# Altium schematic sheet Relay-10A-Sheet.SchDoc
size 420 x 297 mm; SheetNumber: 1; SheetTotal: 1
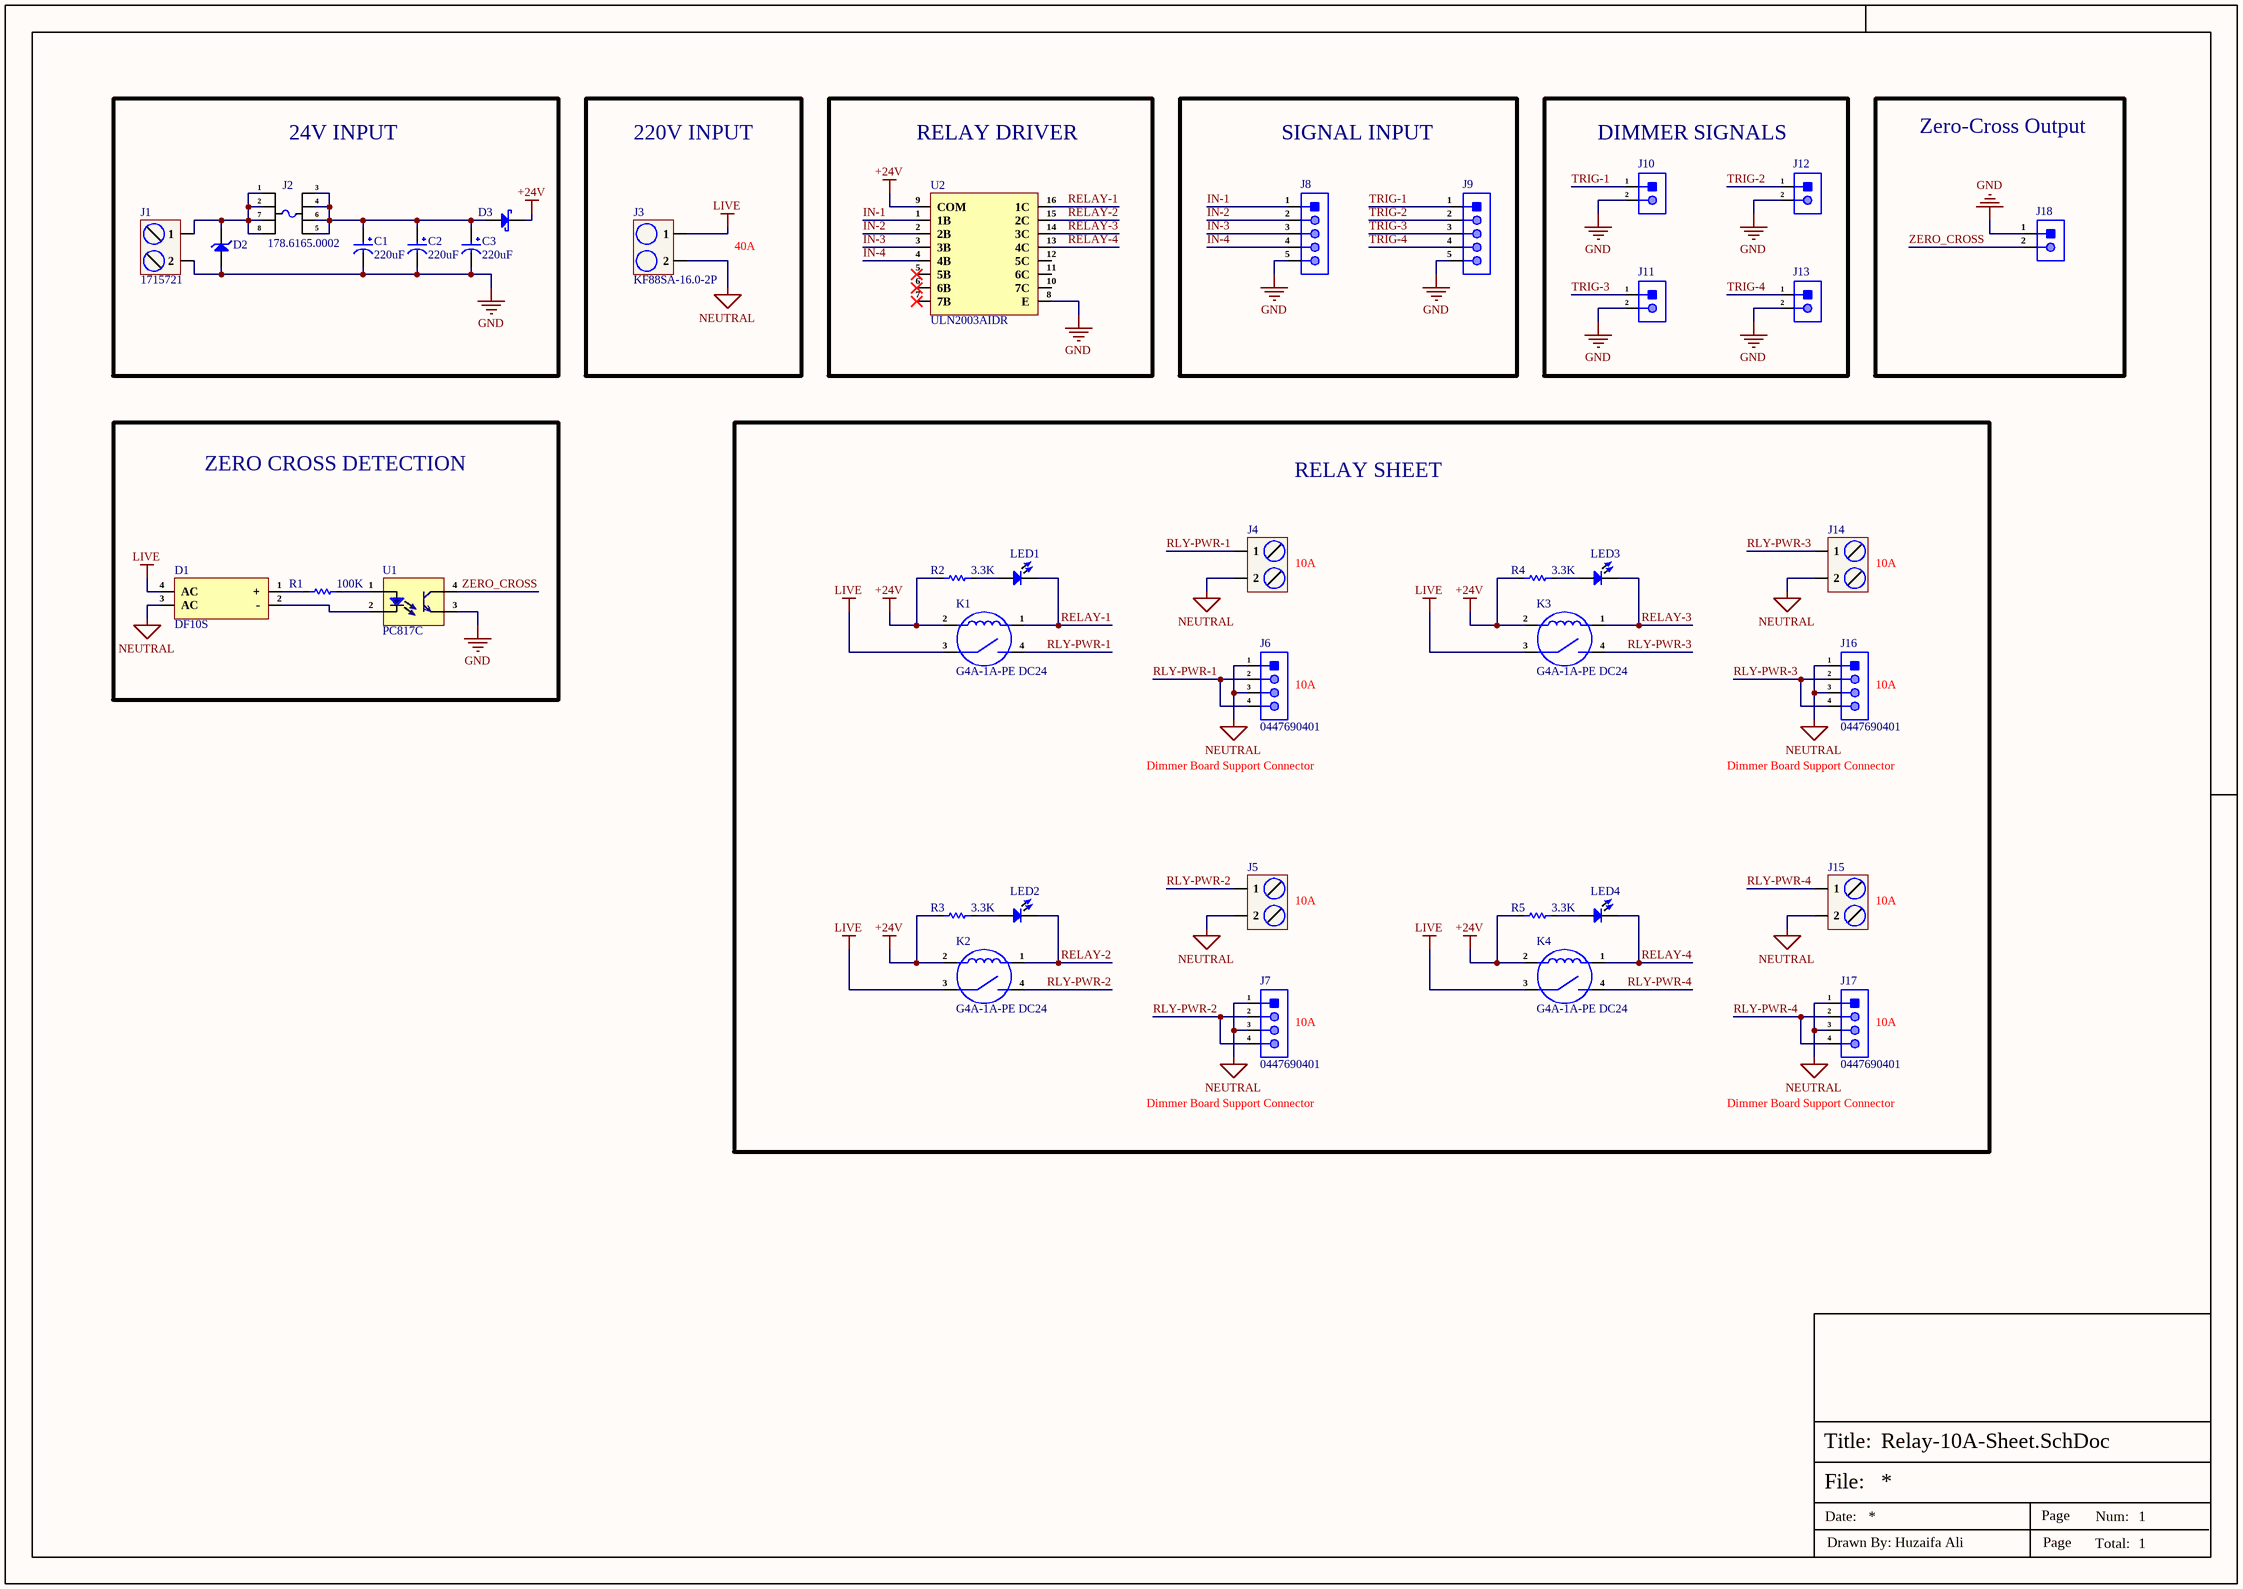
[diagram p0: Relay-10A-Sheet.SchDoc]

## Parts
C1  220uF  [UCD-220uF-10mmDia]
C2  220uF  [UCD-220uF-10mmDia]
C3  220uF  [UCD-220uF-10mmDia]
D1  DF10S  [DF10S]
D2  SMBJ28A-13-F  [SMB_]  (value not drawn)
D3  SS56  [SMA]  (value not drawn)
J1  1715721  [1715721]
J2  178.6165.0002  [178.6165.0002]
J3  KF88SA-16.0-2P  [KF88SA-16.0-2P]
J4  DBT50G-7.62-2P-BK-P  [DBT50G-7.62-2P-BK-P]  (value not drawn)
J5  DBT50G-7.62-2P-BK-P  [DBT50G-7.62-2P-BK-P]  (value not drawn)
J6  0447690401  [0447690401]
J7  0447690401  [0447690401]
J8  B5B-XH-A(LF)(SN)  [B5B-XH-A(LF)(SN)_]  (value not drawn)
J9  B5B-XH-A(LF)(SN)  [B5B-XH-A(LF)(SN)_]  (value not drawn)
J10  X6511FV-02-C85D32  [HDR1X2 (Female)]  (value not drawn)
J11  X6511FV-02-C85D32  [HDR1X2 (Female)]  (value not drawn)
J12  X6511FV-02-C85D32  [HDR1X2 (Female)]  (value not drawn)
J13  X6511FV-02-C85D32  [HDR1X2 (Female)]  (value not drawn)
J14  DBT50G-7.62-2P-BK-P  [DBT50G-7.62-2P-BK-P]  (value not drawn)
J15  DBT50G-7.62-2P-BK-P  [DBT50G-7.62-2P-BK-P]  (value not drawn)
J16  0447690401  [0447690401]
J17  0447690401  [0447690401]
J18  B2B-XH-A(LF)(SN)  [B2B-XH-A(LF)(SN)_]  (value not drawn)
K1  G4A-1A-PE DC24  [G4A-1A-PE DC24]
K2  G4A-1A-PE DC24  [G4A-1A-PE DC24]
K3  G4A-1A-PE DC24  [G4A-1A-PE DC24]
K4  G4A-1A-PE DC24  [G4A-1A-PE DC24]
LED1  Blue  [LED-0603]  (value not drawn)
LED2  Blue  [LED-0603]  (value not drawn)
LED3  Blue  [LED-0603]  (value not drawn)
LED4  Blue  [LED-0603]  (value not drawn)
R1  100K  [MFR50SJT-52-100K]
R2  3.3K  [Res-0402]
R3  3.3K  [Res-0402]
R4  3.3K  [Res-0402]
R5  3.3K  [Res-0402]
U1  PC817C  [PC817C]
U2  ULN2003AIDR  [16-SOIC (0.154", 3.90mm Width)]

## Blocks framed on the sheet
24V INPUT: C1-C3 D2 D3 J1 J2
220V INPUT: J3
RELAY DRIVER: U2
SIGNAL INPUT: J8 J9
DIMMER SIGNALS: J10-J13
Zero-Cross Output: J18
ZERO CROSS DETECTION: D1 R1 U1
RELAY SHEET: J4-J7 J14-J17 K1-K4 LED1-LED4 R2-R5

## Nets
+24V: D3.1(K) K1.2 K2.2 K3.2 K4.2 R2.1 R3.1 R4.1 R5.1 U2.9(COM)
GND: C1.2 C2.2 C3.2 D2.1(A) J1.2 J8.5 J9.5 J10.2 J11.2 J12.2 J13.2 J18.1 U1.3(E) U2.8(E)
LIVE: D1.4(AC) J3.1 K1.3 K2.3 K3.3 K4.3
NEUTRAL: D1.3(AC) J3.2 J4.2 J5.2 J6.1 J6.3 J7.1 J7.3 J14.2 J15.2 J16.1 J16.3 J17.1 J17.3
IN-1: J8.1 U2.1(1B)
IN-2: J8.2 U2.2(2B)
IN-3: J8.3 U2.3(3B)
IN-4: J8.4 U2.4(4B)
RELAY-1: K1.1 LED1.2 U2.16(1C)
RELAY-2: K2.1 LED2.2 U2.15(2C)
RELAY-3: K3.1 LED3.2 U2.14(3C)
RELAY-4: K4.1 LED4.2 U2.13(4C)
RLY-PWR-1: J4.1 J6.2 J6.4 K1.4
RLY-PWR-2: J5.1 J7.2 J7.4 K2.4
RLY-PWR-3: J14.1 J16.2 J16.4 K3.4
RLY-PWR-4: J15.1 J17.2 J17.4 K4.4
TRIG-1: J9.1 J10.1
TRIG-2: J9.2 J12.1
TRIG-3: J9.3 J11.1
TRIG-4: J9.4 J13.1
ZERO_CROSS: J18.2 U1.4(C)
NetC1_1: C1.1 C2.1 C3.1 D3.2(A) J2.3 J2.4 J2.5 J2.6
NetD1_1: D1.1(+) R1.1
NetD1_2: D1.2(-) U1.2(Ca)
NetD2_2: D2.2(K) J1.1 J2.1 J2.2 J2.7 J2.8
NetLED1_1: LED1.1 R2.2
NetLED2_1: LED2.1 R3.2
NetLED3_1: LED3.1 R4.2
NetLED4_1: LED4.1 R5.2
NetR1_2: R1.2 U1.1(An)

Not connected (* = marked no-connect by the designer): U2 5(5B)* 6(6B)* 7(7B)* 10(7C) 11(6C) 12(5C)

## Notes on the sheet
- 40A
- (near J4) 10A
- (near J14) 10A
- (near J6) 10A
- (near J16) 10A
- Dimmer Board Support Connector
- (near J5) 10A
- (near J15) 10A
- (near J7) 10A
- (near J17) 10A
- File:
- Title:
- Date:
- Page
- Num:
- Total:
- Drawn By: Huzaifa Ali

## Library data of the parts
C1-C3 = UCD1H221MNL1GS: CAP ALUM 220UF 20% 50V SMD; Manufacturer: Nichicon; Ripple Current: 700mA; Impedance: 160mR; Leakage Current: 3uA; Life (Hours): 5000Hour; Dissipation Factor: 0.1%; Item Type: Capacitor; Supplier 1: Digi-Key; Manufacturer Part Number: UCD1H221MNL1GS; RoHS: Yes; Category: Aluminum Electrolytic Capacitors; Pricing 1: 1=0.85000, 10=0.60200, 50=0.45480, 100=0.39620 (USD); Mount: Surface Mount,PCB; Case/Package: Radial; Min Operating Temperature: -55°C; Max Operating Temperature: 105°C; Capacitance: 220uF; Tolerance: 20%; Voltage Rating: 50V; Packaging: Tape and Reel; Package Quantity: 1; Voltage Rating (DC): 50V; Termination: SMD/SMT; Voltage: 50V; Features: General Purpose; Series: CD; Construction: Cylindrical; Diameter: 10mm; Length: 10mm; Height: 10mm; Height - Seated (Max): 0.394inch; Radiation Hardening: No; Lead Free: Lead Free; RoHS Compliant: Yes; ComponentLink1URL: https://datasheet.ciiva.com/11776/0900766b80ebdadd-11776792.pdf?src-supplier=RSComponents; ComponentLink1Description: https://datasheet.ciiva.com/11776/0900766b80ebdadd-11776792.pdf?src-supplier=RSComponents; ComponentLink2URL: https://datasheet.ciiva.com/5362/e-cd-22158-5362489.pdf?src-supplier=Mouser; ComponentLink2Description: https://datasheet.ciiva.com/5362/e-cd-22158-5362489.pdf?src-supplier=Mouser; ComponentLink3URL: https://datasheet.ciiva.com/11684/e-cd-11684678.pdf?src-supplier=Avnet; ComponentLink3Description: https://datasheet.ciiva.com/11684/e-cd-11684678.pdf?src-supplier=Avnet; ComponentLink4URL: https://datasheet.ciiva.com/15037/e-cd-15037119.pdf?src-supplier=Digi-Key; ComponentLink4Description: https://datasheet.ciiva.com/15037/e-cd-15037119.pdf?src-supplier=Digi-Key; ComponentLink5URL: https://datasheet.ciiva.com/16393/e-cd-16393493.pdf?src-supplier=Future+Electronics; ComponentLink5Description: https://datasheet.ciiva.com/16393/e-cd-16393493.pdf?src-supplier=Future+Electronics; ComponentLink6URL: https://datasheet.ciiva.com/17354/e-cd-17354606.pdf?src-supplier=Avnet+Europe; ComponentLink6Description: https://datasheet.ciiva.com/17354/e-cd-17354606.pdf?src-supplier=Avnet+Europe; Supplier Part Number 1: 493-6390-1-ND; LCSC Part Number: C116211
D1 = DF10S: 50A 1.1V@1A 1A 1kV DBS Bridge Rectifiers ROHS; Manufacturer: MSKSEMI; Manufacturer Part Number: DF10S; Package: DBS; LCSC Part Number: C5174636; Item Type: Bridge Rectifier; ComponentLink1Description: LCSC; ComponentLink1URL: https://www.lcsc.com/product-detail/Bridge-Rectifiers_MSKSEMI-DF10S_C5174636.html
D2 = SMBJ28A-13-F: TVS DIODE 28VWM 45.4VC SMB; Manufacturer: Diodes; Test Current: 1mA; Number of Elements: 1; Power Dissipation: 600W; Forward Voltage: 5V; Direction: Unidirectional; Reverse Breakdown Voltage: 31.1V; Max Surge Current: 13.2A; Reverse Standoff Voltage: 28V; Clamping Voltage: 45.4V; Power Line Protection: No; Breakdown Voltage: 35.8V; Max Reverse Leakage Current: 5uA; Value: 330pF; Diode Type: ZENER; Supplier: Future Electronics; Supplier Part Number: 8797342; Manufacturer Part Number: SMBJ28A-13-F; RoHS: Yes; Category: TVS Diodes; Stock: 39000; Pricing: 3000=0.0734, 9000=0.0706, 15000=0.0693, 30000=0.0676, 60000=0.065 (USD); Mounting Technology: Surface Mount; Case/Package: SMB; Pins: 2; Min Operating Temperature: -55°C; Max Operating Temperature: 150°C; Packaging: Tape and Reel; Package Quantity: 3000; Max Power Dissipation: 600W; Series: SMBJ; Number of Unidirectional Channels: 1; Min Breakdown Voltage: 31.1V; Peak Pulse Power: 600W; Polarity: Unidirectional; Termination: SMD/SMT; Peak Pulse Current: 13.2A; Max Breakdown Voltage: 35.8V; Leakage Current: 5uA; Working Voltage: 28V; Voltage Rating (DC): 28V; Max Output current: 13.2A; Clamping Voltage-Max: 45.4V; Length: 4.57mm; Width: 3.9mm; Height: 2.62mm; Radiation Hardening: No; RoHS Compliant: Yes; Lead Free: Lead Free; ComponentLink1URL: https://datasheet.ciiva.com/16387/ds19002-16387564.pdf?src-supplier=Future+Electronics; ComponentLink1Description: https://datasheet.ciiva.com/16387/ds19002-16387564.pdf?src-supplier=Future+Electronics; ComponentLink2URL: https://datasheet.ciiva.com/26912/getdatasheetpartid-234000-26912533.pdf?src-supplier=Verical; ComponentLink2Description: https://datasheet.ciiva.com/26912/getdatasheetpartid-234000-26912533.pdf?src-supplier=Verical; Item Type: Diode
D3 = SS56: DIODE SCHOTTKY 60V 5A SMA; Manufacturer: MDD; LCSC Par Number: C65009; Manufacturer Part Number: SS56; Iterm Type: Diode; ComponentLink1Description: LCSC; ComponentLink1URL: https://www.lcsc.com/product-detail/Schottky-Barrier-Diodes-SBD_MDD-Microdiode-Electronics-SS56_C65009.html
J1 = 1715721: TERM BLK 2P SIDE ENT 5.08MM PCB; Manufacturer: Phoenix Contact; Item Type: Terminal Blocks; Supplier: Digikey; Supplier Part Number: 277-1263-ND; Manufacturer Part Number: 1715721; RoHS: Yes; Stock: 13160; Pricing: 1=0.94 (USD); ComponentLink1URL: https://datasheet.ciiva.com/1120/1697161-1120393.pdf?src-supplier=Farnell; ComponentLink1Description: https://datasheet.ciiva.com/1120/1697161-1120393.pdf?src-supplier=Farnell; ComponentLink2URL: https://datasheet.ciiva.com/832/1715721-832095.pdf?src-supplier=Digikey; ComponentLink2Description: https://datasheet.ciiva.com/832/1715721-832095.pdf?src-supplier=Digikey; ComponentLink3URL: https://datasheet.ciiva.com/15169/getdatasheetpartid-212174-15169929.pdf?src-supplier=Verical; ComponentLink3Description: https://datasheet.ciiva.com/15169/getdatasheetpartid-212174-15169929.pdf?src-supplier=Verical; ComponentLink4URL: https://datasheet.ciiva.com/16046/1715721-16046034.pdf?src-supplier=Onlinecomponents.com; ComponentLink4Description: https://datasheet.ciiva.com/16046/1715721-16046034.pdf?src-supplier=Onlinecomponents.com
J2 = 178.6165.0002: FUSE HOLDER BLADE 80V PCB; Manufacturer: Littelfuse Wickmann; Body Material: 4896ConductorMaterial; Current Rating: 30A; Supplier: Future Electronics; Supplier Part Number: 9883406; Manufacturer Part Number: 178.6165.0002; RoHS: Yes; Category: Fuse Holders; Stock: 3811; Pricing: 1=2.02, 40=1.96, 125=1.91, 400=1.86, 1250=1.77 (USD); Material: 4896ConductorMaterial; Width: 17.5mm; Thickness: 6mm; Lead Free: 5697LeadFree; ComponentLink1URL: https://datasheet.ciiva.com/295/littelfuse-ato-pcb-fuse-holders-178-6765-295568.pdf?src-supplier=Digikey; ComponentLink1Description: https://datasheet.ciiva.com/295/littelfuse-ato-pcb-fuse-holders-178-6765-295568.pdf?src-supplier=Digikey; ComponentLink2URL: https://datasheet.ciiva.com/4480/flrholder-58019-4480354.pdf?src-supplier=Mouser; ComponentLink2Description: https://datasheet.ciiva.com/4480/flrholder-58019-4480354.pdf?src-supplier=Mouser; ComponentLink3URL: https://datasheet.ciiva.com/16372/flrholder-16372408.pdf?src-supplier=Future+Electronics; ComponentLink3Description: https://datasheet.ciiva.com/16372/flrholder-16372408.pdf?src-supplier=Future+Electronics; ComponentLink4URL: https://datasheet.ciiva.com/15187/getdatasheetpartid-31610-15187861.pdf?src-supplier=Verical; ComponentLink4Description: https://datasheet.ciiva.com/15187/getdatasheetpartid-31610-15187861.pdf?src-supplier=Verical; LCSC Part Number: C207061; Item Type: Fuse Holder
J3 = KF88SA-16.0-2P: 1x2P Barrier Block 2 1 16mm -40℃~+105℃ 76A 1kV Black 6~14 Straight pin 16 Plugin,P=16mm Barrier Terminal Blocks ROHS; Manufacturer: CiXi KaiFeng Electronics; Supplier: LCSC; LCSC Part Number: C707749; Manufacturer Part Number: KF88SA-16.0-2P; RoHS: No; Item Type: Terminal Block; ComponentLink1Description: LCSC; ComponentLink1URL: https://www.lcsc.com/product-detail/Barrier-Terminal-Blocks_Cixi-Kefa-Elec-KF88SA-16-0-2P_C707749.html
J4 J5 J14 J15 = DBT50G-7.62-2P-BK-P: 1x2P Corner With Cover Plate 2 1 7.62mm -40℃~+105℃ 20A 300V Black 12~22 Straight Needle Plugin,P=7.62mm Barrier Terminal Blocks ROHS; Manufacturer: DORABO; Manufacturer Part Number: DBT50G-7.62-2P-BK-P; Package: Plugin,P=7.62mm; LCSC Part Number: C496127; Item Type: Terminal Block; ComponentLink1Description: LCSC; ComponentLink1URL: https://www.lcsc.com/product-detail/Barrier-Terminal-Blocks_DORABO-DBT50G-7-62-2P-BK-P_C496127.html
J6 J7 J16 J17 = 0447690401: CONN HDR RCPT 4POS VERT TIN PCB; Manufacturer: Molex; Item Type: Female Socket; Supplier: Mouser; Supplier Part Number: 538-44769-0401; Manufacturer Part Number: 0447690401; RoHS: Yes; Stock: 4246; Pricing: 1=1.49, 10=1.31, 50=1.31, 100=1.31, 1000=1.28, 10000=1.27 (USD); ComponentLink1URL: https://datasheet.ciiva.com/3119/0447690401-pcb-receptacles-3119547.pdf?src-supplier=Avnet; ComponentLink1Description: https://datasheet.ciiva.com/3119/0447690401-pcb-receptacles-3119547.pdf?src-supplier=Avnet
J8 J9 = B5B-XH-A(LF)(SN): Conn Shrouded Header HDR 5 POS 2.5mm Solder ST Thru-Hole Box; Manufacturer: JST; Current Rating: 3A; Contact Resistance: 20mR; Voltage Rating (AC): 250V; Number of Positions: 5; Insulation Resistance: 1GR; Gender: Male; Wire/Cable Gauge: 22AWG; Contact Post Length: 0.134inch; Mated Stacking Heights: 9.8mm; Item Type: JST Connector; Supplier 1: Digi-Key; Manufacturer Part Number: B5B-XH-A(LF)(SN); RoHS: Yes; Category: Headers and Wire Housings; Stock 1: 1949; Pricing 1: 1=0.25000, 10=0.23700, 100=0.16440, 500=0.13914, 1000=0.11383, 5000=0.10119, 10000=0.09170 (USD); Mount: Through Hole; Contact Material: Brass; Color: Natural; Contact Plating: Tin,Lead,Copper; Housing Color: White; Housing Material: Polyamide; Contact Shape: Square; Contact Finish - Mating: TIN; Insulation Material: Nylon; Insulation Color: Natural; Min Operating Temperature: -25°C; Max Operating Temperature: 85°C; Number of Rows: 1; Packaging: Bulk; Voltage Rating: 250V; Max Current Rating: 3A; Termination: Press-Fit; Fastening Type: Detent; Number of Contacts: 5; Max Voltage Rating (AC): 250V; Orientation: Straight; Connector Type: Header; Series: XH; Contact Type: Male Pin; Length: 14.9mm; Pitch: 2.5mm; Lead Pitch: 2.5mm; Depth: 5.75mm; Insulation Height: 0.276inch; REACH SVHC: No SVHC; Lead Free: Lead Free; Flammability Rating: UL94 V-0; ComponentLink1URL: https://datasheet.ciiva.com/26894/getdatasheetpartid-455618-26894798.pdf?src-supplier=Verical; ComponentLink1Description: https://datasheet.ciiva.com/26894/getdatasheetpartid-455618-26894798.pdf?src-supplier=Verical; ComponentLink2URL: https://datasheet.ciiva.com/11746/0900766b8082f55f-11746654.pdf?src-supplier=RSComponents; ComponentLink2Description: https://datasheet.ciiva.com/11746/0900766b8082f55f-11746654.pdf?src-supplier=RSComponents; ComponentLink3URL: https://datasheet.ciiva.com/26894/getdatasheetpartid-640991-26894479.pdf?src-supplier=Verical; ComponentLink3Description: https://datasheet.ciiva.com/26894/getdatasheetpartid-640991-26894479.pdf?src-supplier=Verical; ComponentLink4URL: https://datasheet.ciiva.com/8052/1684882-8052063.pdf?src-supplier=Element14; ComponentLink4Description: https://datasheet.ciiva.com/8052/1684882-8052063.pdf?src-supplier=Element14; ComponentLink5URL: https://datasheet.ciiva.com/20207/523653-20207174.pdf?src-supplier=Rapid+Electronics; ComponentLink5Description: https://datasheet.ciiva.com/20207/523653-20207174.pdf?src-supplier=Rapid+Electronics; ComponentLink6URL: https://datasheet.ciiva.com/724/exh-724390.pdf?src-supplier=Digi-Key; ComponentLink6Description: https://datasheet.ciiva.com/724/exh-724390.pdf?src-supplier=Digi-Key; Supplier Part Number 1: 455-2270-ND; LCSC Part Number: C157991
J10-J13 = X6511FV-02-C85D32: 2.54mm Single Row Gold 3A 2P Brass -40℃~+105℃ 250V 260℃ Direct Insert 1x2P 8.5mm Top Square Hole Plugin,P=2.54mm Female Headers ROHS; Manufacturer: XKB Connectivity; Supplier: LCSC; LCSC Part Number: C718243; Manufacturer Part Number: X6511FV-02-C85D32; RoHS: No; Item Type: Female Header
J18 = B2B-XH-A(LF)(SN): Conn Shrouded Header (4 Sides) HDR 2 POS 2.5mm Solder ST Thru-Hole Box; Manufacturer: JST; Number of Positions: 2; Connector Type: Male Pin; Current Rating: 3A; Contact Resistance: 20mR; Voltage Rating: 250V; Insulation Resistance: 1GR; Wire/Cable Gauge: 22AWG; Item Type: JST Connector; Supplier 1: Farnell; Manufacturer Part Number: B2B-XH-A(LF)(SN); RoHS: Yes; Category: FFC / FPC; Stock 1: 219240; Pricing 1: 100=0.06860, 1000=0.04800, 2500=0.04520, 5000=0.04230, 10000=0.03950, 20000=0.03660 (GBP); Mount: Through Hole; Contact Plating: Tin,Copper,Lead; Color: Natural; Contact Material: Brass; Housing Color: White; Housing Material: Polyamide; Min Operating Temperature: -25°C; Max Operating Temperature: 85°C; Number of Rows: 1; Packaging: Bulk; Termination: Solder; Fastening Type: Detent; Max Current Rating: 3A; Voltage Rating (AC): 250V; Max Voltage Rating (AC): 250V; Number of Contacts: 2; Max Voltage Rating (DC): 250V; Orientation: Straight; Length: 7.4mm; Pitch: 2.5mm; Lead Pitch: 2.5mm; Depth: 5.75mm; REACH SVHC: No SVHC; Lead Free: Lead Free; ComponentLink1URL: https://datasheet.ciiva.com/26894/getdatasheetpartid-640357-26894434.pdf?src-supplier=Verical; ComponentLink1Description: https://datasheet.ciiva.com/26894/getdatasheetpartid-640357-26894434.pdf?src-supplier=Verical; ComponentLink2URL: https://datasheet.ciiva.com/11746/0900766b8082653e-11746979.pdf?src-supplier=RSComponents; ComponentLink2Description: https://datasheet.ciiva.com/11746/0900766b8082653e-11746979.pdf?src-supplier=RSComponents; ComponentLink3URL: https://datasheet.ciiva.com/26894/getdatasheetpartid-385291-26894760.pdf?src-supplier=Verical; ComponentLink3Description: https://datasheet.ciiva.com/26894/getdatasheetpartid-385291-26894760.pdf?src-supplier=Verical; ComponentLink4URL: https://datasheet.ciiva.com/8052/5448-8052024.pdf?src-supplier=Element14; ComponentLink4Description: https://datasheet.ciiva.com/8052/5448-8052024.pdf?src-supplier=Element14; ComponentLink5URL: https://datasheet.ciiva.com/20207/523653-20207167.pdf?src-supplier=Rapid+Electronics; ComponentLink5Description: https://datasheet.ciiva.com/20207/523653-20207167.pdf?src-supplier=Rapid+Electronics; Supplier Part Number 1: 1516276; LCSC Part Number: C158012
K1-K4 = G4A-1A-PE DC24: RELAY GEN PURPOSE SPST 20A 24V; Manufacturer: Omron; Supplier: Arrow Electronics; LCSC Part Number: C231366; Manufacturer Part Number: G4A-1A-PE DC24; RoHS: Yes; Item Type: Relay; Stock: 435; Pricing: 20=4.964, 50=4.555, 100=4.412 (USD); ComponentLink1URL: https://omronfs.omron.com/en_US/ecb/products/pdf/en-g4a.pdf?src-supplier=Digikey; ComponentLink1Description: https://omronfs.omron.com/en_US/ecb/products/pdf/en-g4a.pdf?src-supplier=Digikey; ComponentLink2URL: https://datasheet.octopart.com/G4A-1A-PE-DC24-Omron-datasheet-8474777.pdf?src-supplier=Newark; ComponentLink2Description: https://datasheet.octopart.com/G4A-1A-PE-DC24-Omron-datasheet-8474777.pdf?src-supplier=Newark; ComponentLink3URL: https://datasheet.octopart.com/G4A-1A-PE-DC24-Omron-datasheet-151868987.pdf?src-supplier=Master+Electronics; ComponentLink3Description: https://datasheet.octopart.com/G4A-1A-PE-DC24-Omron-datasheet-151868987.pdf?src-supplier=Master+Electronics
LED1-LED4 = NCD0603B3: blue 0603 Light Emitting Diodes (LED) ROHS; Manufacturer: Foshan NationStar Optoelectronics; Manufacturer Part Number: NCD0603B3; Package: 0603; LCSC Part Number: C158101; Item Type: LED; ComponentLink1Description: LCSC; ComponentLink1URL: https://www.lcsc.com/product-detail/Light-Emitting-Diodes-LED_Foshan-NationStar-Optoelectronics-NCD0603B3_C158101.html
R1 = MFR50SJT-52-100K: Metal Film Resistors 100kΩ 500mW ±5% Plugin,D2.4xL6.3mm Through Hole Resistors ROHS; Manufacturer: Yageo; Supplier: Mouser; LCSC Part Number: C176621; Manufacturer Part Number: MFR50SJT-52-100K; Stock: 12355; Pricing: 1=0.1, 10=0.071, 50=0.071, 100=0.029, 1000=0.012, 10000=0.008 (USD); ComponentLink1URL: https://datasheet.octopart.com/MFR50SJT-52-100K-Yageo-datasheet-175665672.pdf?src-supplier=Future+Electronics; ComponentLink1Description: https://datasheet.octopart.com/MFR50SJT-52-100K-Yageo-datasheet-175665672.pdf?src-supplier=Future+Electronics; ComponentLink2URL: https://datasheet.octopart.com/MFR50SJT-52-100K-Yageo-datasheet-165493774.pdf?src-supplier=Future+Electronics; ComponentLink2Description: https://datasheet.octopart.com/MFR50SJT-52-100K-Yageo-datasheet-165493774.pdf?src-supplier=Future+Electronics; ComponentLink3URL: https://datasheet.octopart.com/MFR50SJT-52-100K-Yageo-datasheet-28066692.pdf; ComponentLink3Description: https://datasheet.octopart.com/MFR50SJT-52-100K-Yageo-datasheet-28066692.pdf; Item Type: Resistor
R2-R5 = RC0402FR-073K3L: RES 3.3K OHM 1% 1/16W 0402; Manufacturer: Yageo; Resistance: 3.3kR; Power Rating: 62.5mW; Voltage Rating: 50V; Temperature Coefficient: 100ppm/°C; Max Power Dissipation: 63mW; Item Type: Resistor; Supplier 1: Mouser; Manufacturer Part Number: RC0402FR-073K3L; RoHS: Yes; Category: Chip SMD Resistors; Stock 1: 2413047; Pricing 1: 1=0.10000, 10=0.01400, 50=0.01400, 100=0.00600, 1000=0.00300, 5000=0.00200, 10000=0.00100 (USD); Case/Package: 0402; Number of Pins: 2; Case Code (Imperial): 0402; Case Code (Metric): 1005; Size Code: 0402; Min Operating Temperature: -55°C; Max Operating Temperature: 155°C; Tolerance: 1%; Voltage Rating (DC): 50V; Packaging: Tape and Reel; Package Quantity: 1; Termination: SMD/SMT; Resistor Type: Thick Film; Number of Terminations: 2; Features: Moisture Resistant; Series: RC; Resistance Tolerance: 1%; Technology: THICK FILM; Construction: Rectangular; Length: 1mm; Width: 0.5mm; Height: 0.016inch; Depth: 0.5mm; RoHS Compliant: Yes; REACH SVHC: No SVHC; Military Standard: Not; Lead Free: Lead Free; ComponentLink1URL: https://datasheet.ciiva.com/11808/0900766b80c66297-11808441.pdf?src-supplier=RSComponents; ComponentLink1Description: https://datasheet.ciiva.com/11808/0900766b80c66297-11808441.pdf?src-supplier=RSComponents; ComponentLink2URL: https://datasheet.ciiva.com/46394/1018594-46394940.pdf?src-supplier=Element14; ComponentLink2Description: https://datasheet.ciiva.com/46394/1018594-46394940.pdf?src-supplier=Element14; ComponentLink3URL: https://datasheet.ciiva.com/2453/pyu-r-int-thick-7-2453395.pdf?src-supplier=Digi-Key; ComponentLink3Description: https://datasheet.ciiva.com/2453/pyu-r-int-thick-7-2453395.pdf?src-supplier=Digi-Key; ComponentLink4URL: https://datasheet.ciiva.com/2453/pyu-r-int-thick-7-2453396.pdf?src-supplier=Digi-Key; ComponentLink4Description: https://datasheet.ciiva.com/2453/pyu-r-int-thick-7-2453396.pdf?src-supplier=Digi-Key; ComponentLink5URL: https://datasheet.ciiva.com/2453/pyu-r-int-thick-7-2453394.pdf?src-supplier=Digi-Key; ComponentLink5Description: https://datasheet.ciiva.com/2453/pyu-r-int-thick-7-2453394.pdf?src-supplier=Digi-Key; ComponentLink6URL: https://datasheet.ciiva.com/16746/pyu-rc0402-51-rohs-l-6-r-16746361.pdf?src-supplier=Future+Electronics; ComponentLink6Description: https://datasheet.ciiva.com/16746/pyu-rc0402-51-rohs-l-6-r-16746361.pdf?src-supplier=Future+Electronics; Supplier Part Number 1: 603-RC0402FR-073K3L; LCSC Part Number: C137992
U1 = PC817C: 70V 5kV 50mA 100mV@1mA,20mA 1 6V 1.2V DC SMD-4 Transistor Output Optocoupler ROHS; Manufacturer: Slkor; Item Type: IC; Manufacturer Part Number: PC817C; Package: SMD-4; LCSC Part Number: C2936043; ComponentLink1Description: LCSC; ComponentLink1URL: https://www.lcsc.com/product-detail/Transistor-Output-Optocoupler_Slkor-SLKORMICRO-Elec-PC817C_C2936043.html
U2 = ULN2003AIDR: IC PWR RELAY 7NPN 1:1 16SOIC; Manufacturer: Texas Instruments; Supplier: Mouser; Supplier Part Number: 595-ULN2003AIDR; Manufacturer Part Number: ULN2003AIDR; RoHS: Yes; Item Type: IC; Stock: 2012; Pricing: 1=0.66, 10=0.589, 50=0.589, 100=0.402, 1000=0.285, 10000=0.232 (USD); ComponentLink1URL: https://datasheet.ciiva.com/15139/getdatasheetpartid-47948-15139878.pdf?src-supplier=Verical; ComponentLink1Description: https://datasheet.ciiva.com/15139/getdatasheetpartid-47948-15139878.pdf?src-supplier=Verical; ComponentLink2URL: https://datasheet.ciiva.com/14424/ulq2003a-14424030.pdf?src-supplier=Avnet; ComponentLink2Description: https://datasheet.ciiva.com/14424/ulq2003a-14424030.pdf?src-supplier=Avnet; ComponentLink3URL: https://datasheet.ciiva.com/1700/uln2003ai-1700820.pdf?src-supplier=Digikey; ComponentLink3Description: https://datasheet.ciiva.com/1700/uln2003ai-1700820.pdf?src-supplier=Digikey; ComponentLink4URL: https://datasheet.ciiva.com/1700/uln2003ai-1700821.pdf?src-supplier=Digikey; ComponentLink4Description: https://datasheet.ciiva.com/1700/uln2003ai-1700821.pdf?src-supplier=Digikey; ComponentLink5URL: https://datasheet.ciiva.com/1700/uln2003ai-1700822.pdf?src-supplier=Digikey; ComponentLink5Description: https://datasheet.ciiva.com/1700/uln2003ai-1700822.pdf?src-supplier=Digikey